# Altium schematic sheet 08_Debug.SchDoc
size A4; SheetNumber: 9; SheetTotal: 13
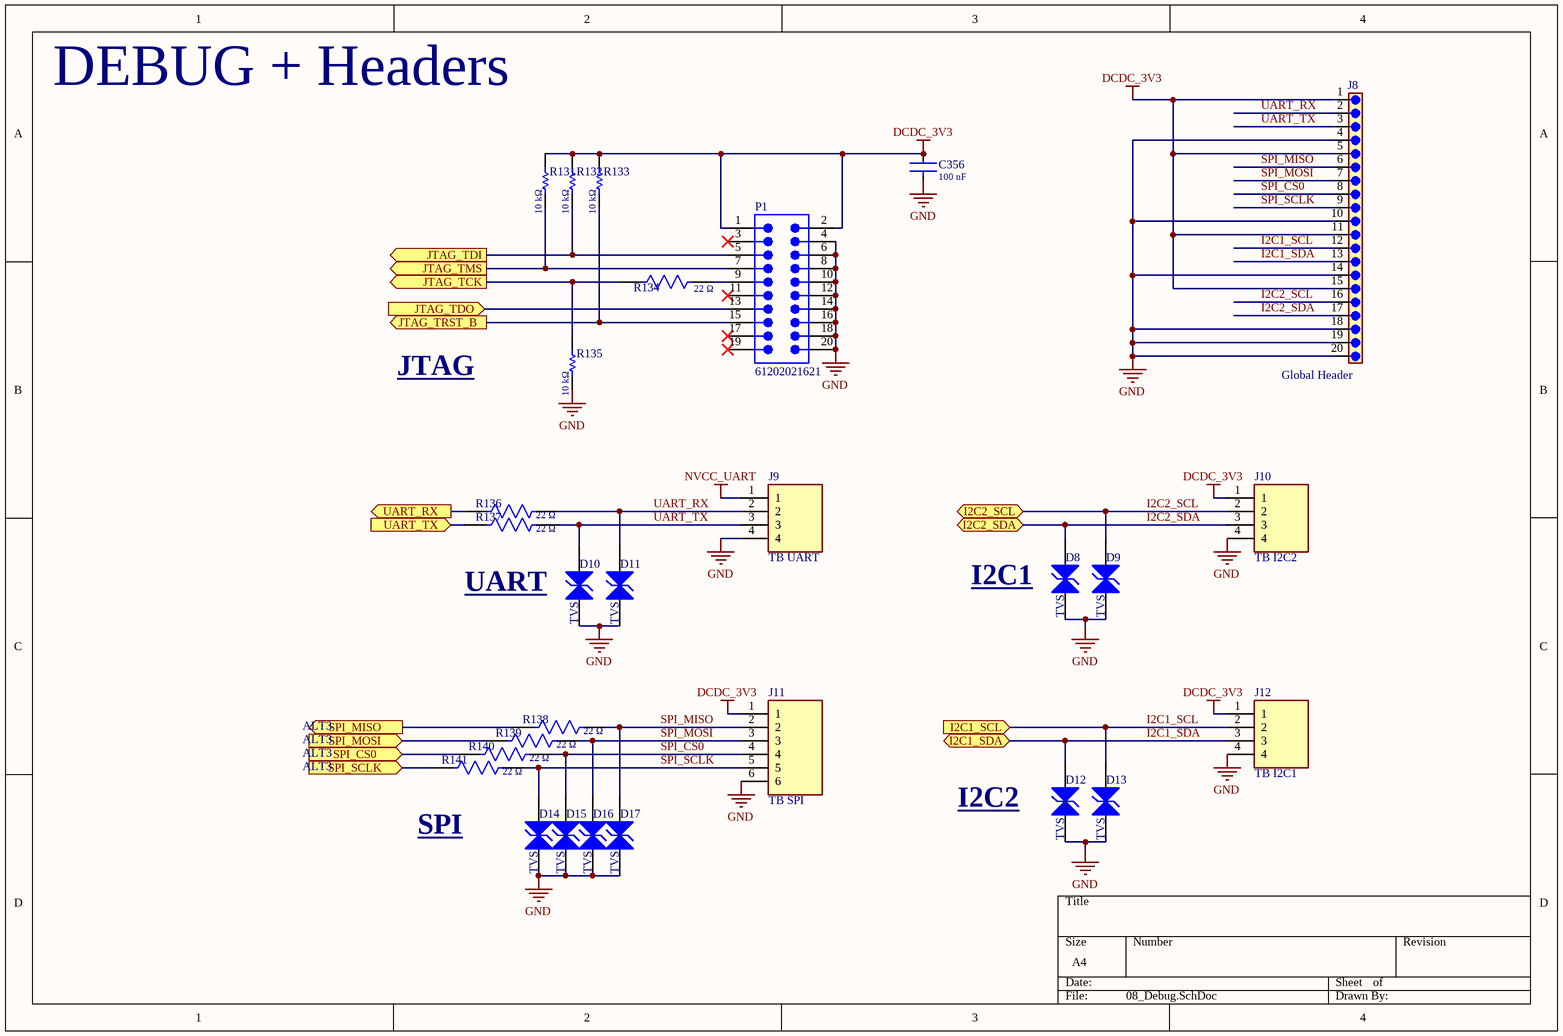
[diagram p0: 08_Debug.SchDoc]

## Parts
C356  100 nF  [FP-CC0603-DA-MFG]
D8  TVS  [WE-TVSP_DO-214AA_Bidirectional]
D9  TVS  [WE-TVSP_DO-214AA_Bidirectional]
D10  TVS  [WE-TVSP_DO-214AA_Bidirectional]
D11  TVS  [WE-TVSP_DO-214AA_Bidirectional]
D12  TVS  [WE-TVSP_DO-214AA_Bidirectional]
D13  TVS  [WE-TVSP_DO-214AA_Bidirectional]
D14  TVS  [WE-TVSP_DO-214AA_Bidirectional]
D15  TVS  [WE-TVSP_DO-214AA_Bidirectional]
D16  TVS  [WE-TVSP_DO-214AA_Bidirectional]
D17  TVS  [WE-TVSP_DO-214AA_Bidirectional]
J8  Global Header  [61302011121]
J9  TB UART  [TE_282834-4]
J10  TB I2C2  [TE_282834-4]
J11  TB SPI  [TE_282834-6]
J12  TB I2C1  [TE_282834-4]
P1  61202021621  [61202021621]
R131  10 kΩ  [RESC1608X55X25ML10T15]
R132  10 kΩ  [RESC1608X55X25ML10T15]
R133  10 kΩ  [RESC1608X55X25ML10T15]
R134  22 Ω  [FP-RC0603-0_55-IPC_C]
R135  10 kΩ  [RESC1608X55X25ML10T15]
R136  22 Ω  [FP-RC0603-0_55-IPC_C]
R137  22 Ω  [FP-RC0603-0_55-IPC_C]
R138  22 Ω  [FP-RC0603-0_55-IPC_C]
R139  22 Ω  [FP-RC0603-0_55-IPC_C]
R140  22 Ω  [FP-RC0603-0_55-IPC_C]
R141  22 Ω  [FP-RC0603-0_55-IPC_C]

## Ports
I2C1_SCL (in), I2C1_SDA (bidir), I2C2_SCL (bidir), I2C2_SDA (bidir), JTAG_TCK (out), JTAG_TDI (out), JTAG_TDO (in), JTAG_TMS (out), JTAG_TRST_B (out), SPI_CS0 (in), SPI_MISO (out), SPI_MOSI (in), SPI_SCLK (in), UART_RX (out), UART_TX (in)

## Nets
DCDC_3V3: C356.2 J8.1 J8.5 J8.11 J8.15 J10.1 J11.1 J12.1 P1.1 P1.2 R131.1 R132.1 R133.1
GND: C356.1 D8.1 D9.1 D10.1 D11.1 D12.1 D13.1 D14.1 D15.1 D16.1 D17.1 J8.4 J8.10 J8.14 J8.18 J8.19 J8.20 J9.4 J10.4 J11.6 J12.4 P1.4 P1.6 P1.8 P1.10 P1.12 P1.14 P1.16 P1.18 P1.20 R135.2
NVCC_UART: J9.1
I2C1_SCL: D13.2 J8.12 J12.2 ; port I2C1_SCL
I2C1_SDA: D12.2 J8.13 J12.3 ; port I2C1_SDA
I2C2_SCL: D9.2 J8.16 J10.2 ; port I2C2_SCL
I2C2_SDA: D8.2 J8.17 J10.3 ; port I2C2_SDA
JTAG_TCK: R134.1 R135.1 ; port JTAG_TCK
JTAG_TDI: P1.5 R132.2 ; port JTAG_TDI
JTAG_TDO: P1.13 ; port JTAG_TDO
JTAG_TMS: P1.7 R131.2 ; port JTAG_TMS
JTAG_TRST_B: P1.15 R133.2 ; port JTAG_TRST_B
SPI_CS0: R140.1 ; port SPI_CS0
SPI_CS0: D15.2 J8.8 J11.4 R140.2  [a separate net that carries the same name]
SPI_MISO: R138.1 ; port SPI_MISO
SPI_MISO: D17.2 J8.6 J11.2 R138.2  [a separate net that carries the same name]
SPI_MOSI: R139.1 ; port SPI_MOSI
SPI_MOSI: D16.2 J8.7 J11.3 R139.2  [a separate net that carries the same name]
SPI_SCLK: R141.1 ; port SPI_SCLK
SPI_SCLK: D14.2 J8.9 J11.5 R141.2  [a separate net that carries the same name]
UART_RX: R136.1 ; port UART_RX
UART_RX: D11.2 J8.2 J9.2 R136.2  [a separate net that carries the same name]
UART_TX: R137.1 ; port UART_TX
UART_TX: D10.2 J8.3 J9.3 R137.2  [a separate net that carries the same name]
NetP1_9: P1.9 R134.2

Not connected (* = marked no-connect by the designer): P1 3* 11* 17* 19*

## Notes on the sheet
- DEBUG + Headers
- JTAG
- UART
- (near D8) I2C1
- ALT3
- SPI
- (near D12) I2C2

## Library data of the parts
C356 = CMP-2100-03601-2: CAP CER 0.1UF 50V X7R 0603; Manufacturer: YAGEO; Manufacturer Part Number: CC0603KRX7R9BB104; Material: Ceramic; Temperature Coefficient: 15%; Tolerance: 0.1; Height: 0.9mm; Voltage: 50 V; ComponentLink2Description: Datasheet; Device Class L2: Capacitors; Temperature Range High: +125°C; Category: Cap; Capacitance: 100 nF; Footprint Url: http://www.yageo.com/exep/pages/download/literatures/UPY-C_GEN_24.pdf; ComponentLink2URL: http://www.yageo.com/documents/recent/UPY-GPHC_X7R_6.3V-to-50V_18.pdf; Package: CC0603-DA; Temperature: -55°C to +125°C; Voltage Rating: 50 V; Temperature Characteristic: X7R; Device Class L1: Passive Components; Temperature Range Low: -55°C; RoHS: TRUE; Automotive: No; Value: 100 nF; Device Class L3: Ceramic Capacitors; Octopart: https://octopart.com/cc0603krx7r9bb104-yageo-42244635; Mouser Description: Multilayer Ceramic Capacitor, CC Series, 0.1 - F, - 10%, X7R, 50 V, 0603 [1608 Metric]; Lead Free: Yes; Digikey Description: CAP CER 0.1UF 50V X7R 0603
D8-D17 = CMP-03913-71101643-2: TVS diode [Würth Elektronik] 824521751 TVS diode; Leakage Current: 1µA; Min Breakdown Voltage: 87.7V; Peak Pulse Power: 600W; Power Line Protection: No; Peak Pulse Current: 5A; Number of Bidirectional Channels: 1; Reverse Standoff Voltage: 75V; Clamping Voltage: 121V; Polarity: Bidirectional; Length: 4.32mm; Packaging: Cut Tape; Composition: Zener; Max Operating Temperature: 150°C; Breakdown Voltage: 87.7V; Height: 2.4mm; REACH SVHC: Unknown; Mount: Surface Mount; Number of Pins: 2; Min Operating Temperature: -65°C; Width: 3.62mm; Max Breakdown Voltage: 87.7V; RoHS: Compliant
J8 = 6130XX11121_61302011121: 20 pins, 1 row, straight, gold plating; MF: Wurth Elektronik; SnapEDA_Link: https://www.snapeda.com/parts/61302011121/Wurth+Electronics/view-part/?ref=snap; Package: None; Value: *; MP: 61302011121; Check_prices: https://www.snapeda.com/parts/61302011121/Wurth+Electronics/view-part/?ref=eda
J9 J10 J12 = 282834-4: Conn; Term Blk; PCB; Wire Receptacle; 4; 2.54mm; 30-16AWG; Green; 10A;150V; M1.6 | TE Connectivity 282834-4; Number_of_Positions: 4; Centerline_Pitch: 2.54 mm[.1 in]; SnapEDA_Link: https://www.snapeda.com/parts/282834-4/TE+Connectivity+AMP+Connectors/view-part/?ref=snap; Package: None; Value: *; MF: TE Connectivity; MP: 282834-4; EU_RoHS_Compliance: Compliant with Exemptions; Check_prices: https://www.snapeda.com/parts/282834-4/TE+Connectivity+AMP+Connectors/view-part/?ref=eda
J11 = 282834-6: Conn; Term Blk; PCB; Wire Receptacle; 6; 2.54mm; 30-16AWG; Green; 10A;150V; M1.6 | TE Connectivity 282834-6; SnapEDA_Link: https://www.snapeda.com/parts/282834-6/TE+Connectivity+AMP+Connectors/view-part/?ref=snap; Package: None; Value: *; MF: TE Connectivity; MP: 282834-6; EU_RoHS_Compliance: Compliant with Exemptions; Check_prices: https://www.snapeda.com/parts/282834-6/TE+Connectivity+AMP+Connectors/view-part/?ref=eda
P1 = CMP-1502-00010-3: WR-BHD Straight Male, Box Header, Through Hole, 2 Rows, 20 Contacts, 2.54mm Pitch; Insulation Resistance: 1GΩ; Number of Contacts: 20; Current Rating: 3A; Voltage Rating: 250V; Connector Type: Male Pin; Contact Resistance: 20mΩ; Insulation: Insulated; Mount: Through Hole; Length: 33.06mm; Min Operating Temperature: -40°C; Orientation: Vertical; Number of Rows: 2; Width: 33.06mm; Row Spacing: 2.54mm; Flammability Rating: UL94 V-0; Contact Gender: Male; Lead Pitch: 2.54mm; Housing Material: PBT; Voltage Rating (DC): 250V; Pitch: 2.54mm; Termination: Through Hole; Number of Pins: 20; RoHS: Compliant; Insulation Material: PBT; Gender: Male; Contact Material: Gold; Number of Positions: 20; Max Operating Temperature: 105°C; Operating Supply Voltage: 250V; Height: 9.25mm; Contact Plating: Gold; Color: Black
R131-R133 R135 = CMP-2000-05022-1: Resistor, 10 KOhm, +/- 5%, 100 mW, -55 to 155 degC, 0603 (1608 Metric), RoHS, Tape and Reel; Manufacturer: Yageo; Resistance: 10kOhms; Voltage Rating: 50V; Temperature Coefficient: 100PPM/C; Power Rating: 100mW; Package Reference: 603; Series: RC; Case Code - mm: 1608; Packaging: Reel; Datasheet URL: http://www.farnell.com/datasheets/443971.pdf; Datasheet Version: Rev. 4, 04/2009; Operating Temperature Range: -55Cto+155C; Product: ThickFilmResistorsGeneralPurpose; Package Description: 2-Pin Surface Mount Device, Body 1.6 x 0.8 mm; Manufacturer URL: http://www.yageo.com/; Case Code - in: 0603; Tolerance: 5%; Termination Style: SMD/SMT
R134 R136-R141 = CMP-03412-037819-1: RES SMD 22 OHM 5% 1/10W 0603; Temperature Coefficient: 100ppm/°C; Max Power Dissipation: 100mW; Voltage Rating: 50V; Resistance: 22R; Length: 1.6mm; Tolerance: 5%; Resistance Tolerance: 5%; Number of Terminations: 2; Construction: Rectangular; Min Operating Temperature: -55°C; Lead Free: Lead Free; Width: 0.8mm; Case Code (Imperial): 0603; Voltage Rating (DC): 50V; Case/Package: 0603; Features: Moisture Resistant; REACH SVHC: No SVHC; Military Standard: Not; RoHS Compliant: Yes; Max Operating Temperature: 155°C; Number of Pins: 2; Termination: SMD/SMT; Case Code (Metric): 1608; Packaging: Tape and Reel; Resistor Type: Thick Film; Depth: 0.8mm; Size Code: 0603; Power Rating: 100mW; Series: RC